# Altium schematic sheet TuringSMD_FRONT.SchDoc
size A4; SheetNumber: 3; SheetTotal: 3
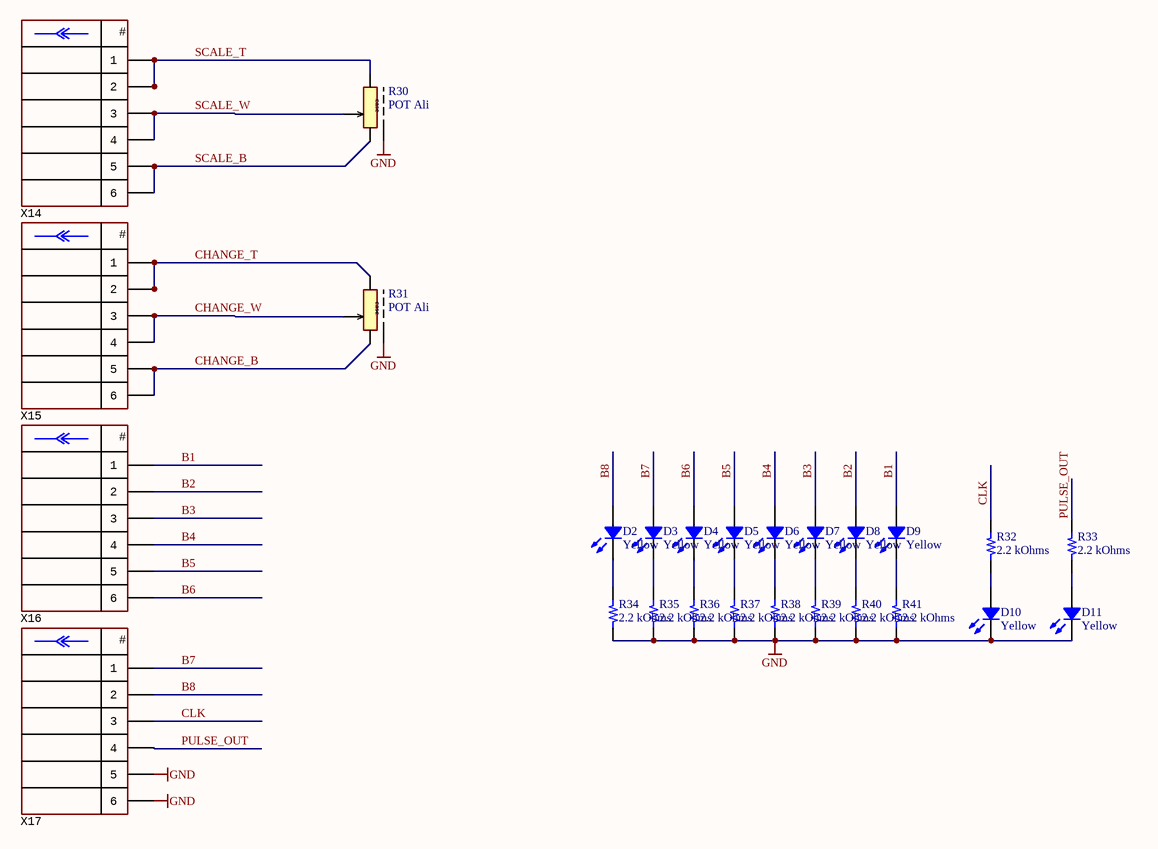
[diagram p0: TuringSMD_FRONT.SchDoc]

## Parts
D2  Yellow  [LED 0805_2012 YELLOW]
D3  Yellow  [LED 0805_2012 YELLOW]
D4  Yellow  [LED 0805_2012 YELLOW]
D5  Yellow  [LED 0805_2012 YELLOW]
D6  Yellow  [LED 0805_2012 YELLOW]
D7  Yellow  [LED 0805_2012 YELLOW]
D8  Yellow  [LED 0805_2012 YELLOW]
D9  Yellow  [LED 0805_2012 YELLOW]
D10  Yellow  [LED 0805_2012 YELLOW]
D11  Yellow  [LED 0805_2012 YELLOW]
R30  POT Ali  [POT_ALI]
R31  POT Ali  [POT_ALI]
R32  2.2 kOhms  [YAGEO RES 0603_1608]
R33  2.2 kOhms  [YAGEO RES 0603_1608]
R34  2.2 kOhms  [YAGEO RES 0603_1608]
R35  2.2 kOhms  [YAGEO RES 0603_1608]
R36  2.2 kOhms  [YAGEO RES 0603_1608]
R37  2.2 kOhms  [YAGEO RES 0603_1608]
R38  2.2 kOhms  [YAGEO RES 0603_1608]
R39  2.2 kOhms  [YAGEO RES 0603_1608]
R40  2.2 kOhms  [YAGEO RES 0603_1608]
R41  2.2 kOhms  [YAGEO RES 0603_1608]
X14  (no value)  [CON: PBD-6]
X15  (no value)  [CON: PBD-6]
X16  (no value)  [CON: PBD-6]
X17  (no value)  [CON: PBD-6]

## Nets
GND: D10.2 D11.2 R30.G R31.G R34.1 R35.1 R36.1 R37.1 R38.1 R39.1 R40.1 R41.1 X17.5 X17.6
B1: D9.1 X16.1
B2: D8.1 X16.2
B3: D7.1 X16.3
B4: D6.1 X16.4
B5: D5.1 X16.5
B6: D4.1 X16.6
B7: D3.1 X17.1
B8: D2.1 X17.2
CHANGE_B: R31.B X15.5 X15.6
CHANGE_T: R31.T X15.1 X15.2
CHANGE_W: R31.W X15.3 X15.4
CLK: R32.2 X17.3
PULSE_OUT: R33.2 X17.4
SCALE_B: R30.B X14.5 X14.6
SCALE_T: R30.T X14.1 X14.2
SCALE_W: R30.W X14.3 X14.4
NetD2_2: D2.2 R34.2
NetD3_2: D3.2 R35.2
NetD4_2: D4.2 R36.2
NetD5_2: D5.2 R37.2
NetD6_2: D6.2 R38.2
NetD7_2: D7.2 R39.2
NetD8_2: D8.2 R40.2
NetD9_2: D9.2 R41.2
NetD10_1: D10.1 R32.1
NetD11_1: D11.1 R33.1

## Notes on the sheet
- (in symbol PBD-6) #
- (in symbol POT Ali) case

## Library data of the parts
D2-D11 = SML-LX0805YC-TR: LED YELLOW CLEAR SMD; Manufacturer: Lumex Opto/Components Inc.; Configuration: Standard; Current - Test: 20mA; Lens Color: Colorless; Lens Size: 1.40mm x 1.25mm; Lens Style: Rectangle with Flat Top; Millicandela Rating: 9mcd; Viewing Angle: 140°; Voltage - Forward (Vf) (Typ): 2.1V; Wavelength - Peak: 585nm; Part Number: SML-LX0805YC-TR; Color: Yellow; ComponentLink1Description: Datasheet; ComponentLink1URL: https://www.lumex.com/content/files/ProductAttachment/SML-LX0805YC-TR.pdf; ComponentLink2Description: DigiKey Link; ComponentLink2URL: https://www.digikey.com/en/products/detail/lumex-opto-components-inc/SML-LX0805YC-TR/515791; Device Package: 0805 (2012 Metric); Height (Max): 1.20mm; LastUpdated: 6/3/2024 8:01:27 PM; Lens Transparency: Clear; Lifecycle Status: Active; Minimum Order: 1; Mounting Type: Surface Mount; Package / Case: 0805 (2012 Metric); Packaging: TapeAndReel; PartId: 39; Part Status: Active; Price: 0.04; Series: -; Size / Dimension: 2.00mm L x 1.25mm W; Supplier 1: DigiKey; Supplier Part Number 1: 67-2192-1-ND; Value: Yellow
R32-R41 = AA0603FR-072K2L: RES SMD 2.2K OHM 1% 1/10W 0603; Manufacturer: Yageo; Power (Watts): 0.1W, 1/10W; Temperature Coefficient: ±150ppm/°C; Part Number: AA0603FR-072K2L; Value: 2.2 kOhms; ComponentLink1Description: Datasheet; ComponentLink1URL: https://www.yageo.com/upload/media/product/app/datasheet/rchip/pyu-aa_51_rohs_l.pdf; ComponentLink2Description: DigiKey Link; ComponentLink2URL: https://www.digikey.com/en/products/detail/yageo/AA0603FR-072K2L/5888997; Composition: Thick Film; Device Package: 0603 (1608 Metric); Features: Anti-Sulfur, Automotive AEC-Q200, Moisture Resistant; Height - Seated (Max): 0.022" (0.55mm); LastUpdated: 7/25/2024 9:18:54 AM; Lifecycle Status: Active; Minimum Order: 1; Number of Terminations: 2; Operating Temperature: -55°C ~ 155°C; Package / Case: 0603 (1608 Metric); Packaging: TapeAndReel; PartId: 86838; Price: 0.01; Ratings: AEC-Q200; Resistance: 2.2 kOhms; Series: AA; Size / Dimension: 0.063" L x 0.031" W (1.60mm x 0.80mm); Supplier 1: DigiKey; Supplier Part Number 1: 13-AA0603FR-072K2LCT-ND; Supplier Device Package: 0603; Tolerance: ±1%
X14-X17 = PBD-6: Manufacturer: Connfly; ValueManufacturerPartNumber: Connector, 6pin, 2.54mm, 500VAC, 3A; TypeConnector: Connector; VoltageMax: 500VAC; Pitch: 2.54mm; CurrentMax: 3A; Multichannel: 6pin; CommentText: "Разъем"; HelpURL: https://www.chipdip.ru/product/pbd-6; PartNumber: PBD-6